# Altium project Control-Board-v1.0.PrjPcb (part 1 of 7)
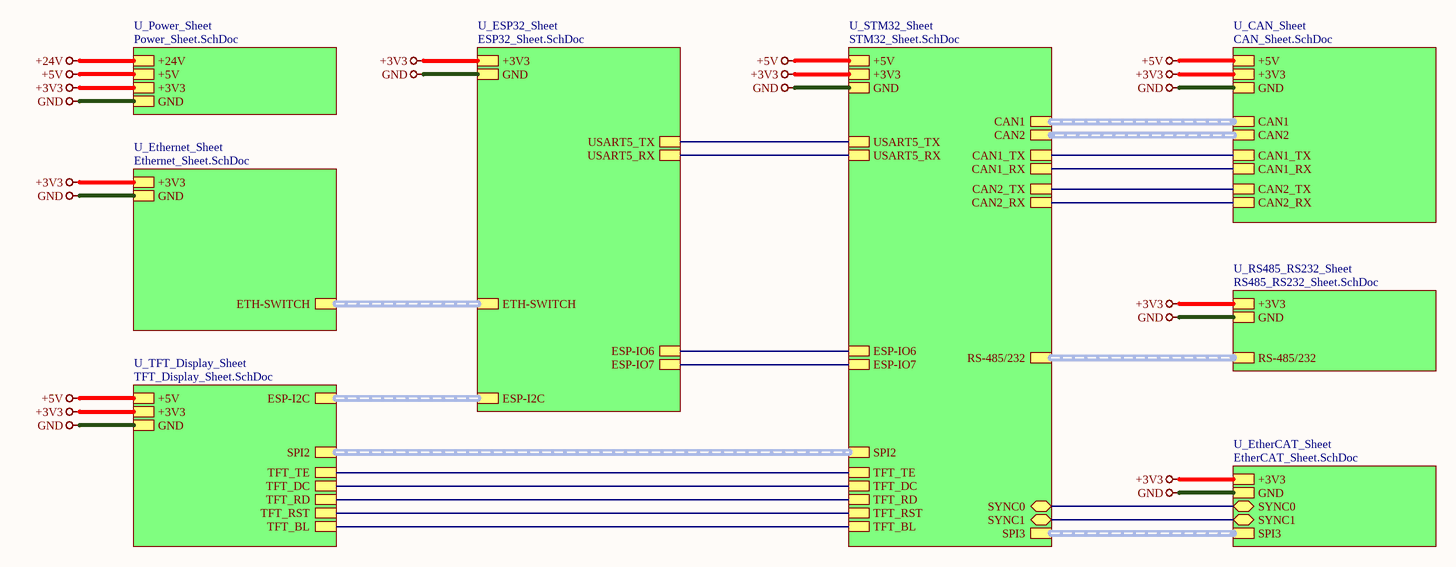
[diagram p0: Top-Sheet.SchDoc]
9 sheets, 501 parts. Net scope: hierarchical (ports join the sheet entries above them; power ports are global).
Board file: Control Board-v1.0.PcbDoc
Sheets:
  Top-Sheet.SchDoc
    U_Power_Sheet = Power_Sheet.SchDoc
    U_ESP32_Sheet = ESP32_Sheet.SchDoc
    U_CAN_Sheet = CAN_Sheet.SchDoc
    U_RS485_RS232_Sheet = RS485_RS232_Sheet.SchDoc
    U_TFT_Display_Sheet = TFT_Display_Sheet.SchDoc
    U_STM32_Sheet = STM32_Sheet.SchDoc
    U_EtherCAT_Sheet = EtherCAT_Sheet.SchDoc
    U_Ethernet_Sheet = Ethernet_Sheet.SchDoc

## Sheet Top-Sheet.SchDoc
size 420 x 297 mm; SheetNumber: 1; SheetTotal: 9

### Sub-sheets
U_CAN_Sheet = CAN_Sheet.SchDoc: CAN1 (harness CAN1), CAN2_RX, CAN2_TX, +5V, +3V3, GND, CAN1_RX, CAN1_TX, CAN2 (harness CAN2)
U_ESP32_Sheet = ESP32_Sheet.SchDoc: +3V3, GND, USART5_TX, USART5_RX, ESP-IO6, ESP-IO7, ESP-I2C (harness ESP-I2C), ETH-SWITCH (harness ETH-SWITCH)
U_EtherCAT_Sheet = EtherCAT_Sheet.SchDoc: +3V3, GND, SYNC0 (bidir), SYNC1 (bidir), SPI3 (harness SPI3)
U_Ethernet_Sheet = Ethernet_Sheet.SchDoc: +3V3, GND, ETH-SWITCH (harness ETH-SWITCH)
U_Power_Sheet = Power_Sheet.SchDoc: +24V, +5V, +3V3, GND
U_RS485_RS232_Sheet = RS485_RS232_Sheet.SchDoc: RS-485/232 (harness RS-485/232), +3V3, GND
U_STM32_Sheet = STM32_Sheet.SchDoc: USART5_TX, USART5_RX, CAN1 (harness CAN1), CAN2_RX, CAN2_TX, +5V, +3V3, GND, CAN1_RX, CAN1_TX, CAN2 (harness CAN2), SYNC0 (bidir), SYNC1 (bidir), SPI3 (harness SPI3), SPI2 (harness SPI2), ESP-IO6, ESP-IO7, TFT_TE, TFT_DC, TFT_RD, TFT_RST, RS-485/232 (harness RS-485/232), TFT_BL
U_TFT_Display_Sheet = TFT_Display_Sheet.SchDoc: +3V3, GND, +5V, ESP-I2C (harness ESP-I2C), SPI2 (harness SPI2), TFT_TE, TFT_DC, TFT_RD, TFT_RST, TFT_BL

### Nets
+3V3: sheet U_Power_Sheet/+3V3, sheet U_ESP32_Sheet/+3V3, sheet U_CAN_Sheet/+3V3, sheet U_RS485_RS232_Sheet/+3V3, sheet U_TFT_Display_Sheet/+3V3, sheet U_STM32_Sheet/+3V3, sheet U_EtherCAT_Sheet/+3V3, sheet U_Ethernet_Sheet/+3V3
+5V: sheet U_Power_Sheet/+5V, sheet U_CAN_Sheet/+5V, sheet U_TFT_Display_Sheet/+5V, sheet U_STM32_Sheet/+5V
GND: sheet U_Power_Sheet/GND, sheet U_ESP32_Sheet/GND, sheet U_CAN_Sheet/GND, sheet U_RS485_RS232_Sheet/GND, sheet U_TFT_Display_Sheet/GND, sheet U_STM32_Sheet/GND, sheet U_EtherCAT_Sheet/GND, sheet U_Ethernet_Sheet/GND
CAN1_RX: sheet U_CAN_Sheet/CAN1_RX, sheet U_STM32_Sheet/CAN1_RX
CAN1_TX: sheet U_CAN_Sheet/CAN1_TX, sheet U_STM32_Sheet/CAN1_TX
CAN2_RX: sheet U_CAN_Sheet/CAN2_RX, sheet U_STM32_Sheet/CAN2_RX
CAN2_TX: sheet U_CAN_Sheet/CAN2_TX, sheet U_STM32_Sheet/CAN2_TX
ESP-IO6: sheet U_ESP32_Sheet/ESP-IO6, sheet U_STM32_Sheet/ESP-IO6
ESP-IO7: sheet U_ESP32_Sheet/ESP-IO7, sheet U_STM32_Sheet/ESP-IO7
SYNC0: sheet U_STM32_Sheet/SYNC0, sheet U_EtherCAT_Sheet/SYNC0
SYNC1: sheet U_STM32_Sheet/SYNC1, sheet U_EtherCAT_Sheet/SYNC1
TFT_BL: sheet U_TFT_Display_Sheet/TFT_BL, sheet U_STM32_Sheet/TFT_BL
TFT_DC: sheet U_TFT_Display_Sheet/TFT_DC, sheet U_STM32_Sheet/TFT_DC
TFT_RD: sheet U_TFT_Display_Sheet/TFT_RD, sheet U_STM32_Sheet/TFT_RD
TFT_RST: sheet U_TFT_Display_Sheet/TFT_RST, sheet U_STM32_Sheet/TFT_RST
TFT_TE: sheet U_TFT_Display_Sheet/TFT_TE, sheet U_STM32_Sheet/TFT_TE
USART5_RX: sheet U_ESP32_Sheet/USART5_RX, sheet U_STM32_Sheet/USART5_RX
USART5_TX: sheet U_ESP32_Sheet/USART5_TX, sheet U_STM32_Sheet/USART5_TX

### Buses and harness runs
harness sheet U_CAN_Sheet/CAN1 = sheet U_STM32_Sheet/CAN1
harness sheet U_CAN_Sheet/CAN2 = sheet U_STM32_Sheet/CAN2
harness sheet U_ESP32_Sheet/ESP-I2C = sheet U_TFT_Display_Sheet/ESP-I2C
harness sheet U_ESP32_Sheet/ETH-SWITCH = sheet U_Ethernet_Sheet/ETH-SWITCH
harness sheet U_EtherCAT_Sheet/SPI3 = sheet U_STM32_Sheet/SPI3
harness sheet U_RS485_RS232_Sheet/RS-485/232 = sheet U_STM32_Sheet/RS-485/232
harness sheet U_STM32_Sheet/SPI2 = sheet U_TFT_Display_Sheet/SPI2

### Notes on the sheet
- File:
- Title:
- Date:
- Page
- Num:
- Total:
- Drawn By: Huzaifa Ali

## Sheet Power_Sheet.SchDoc
size 420 x 297 mm; SheetNumber: 2; SheetTotal: 9
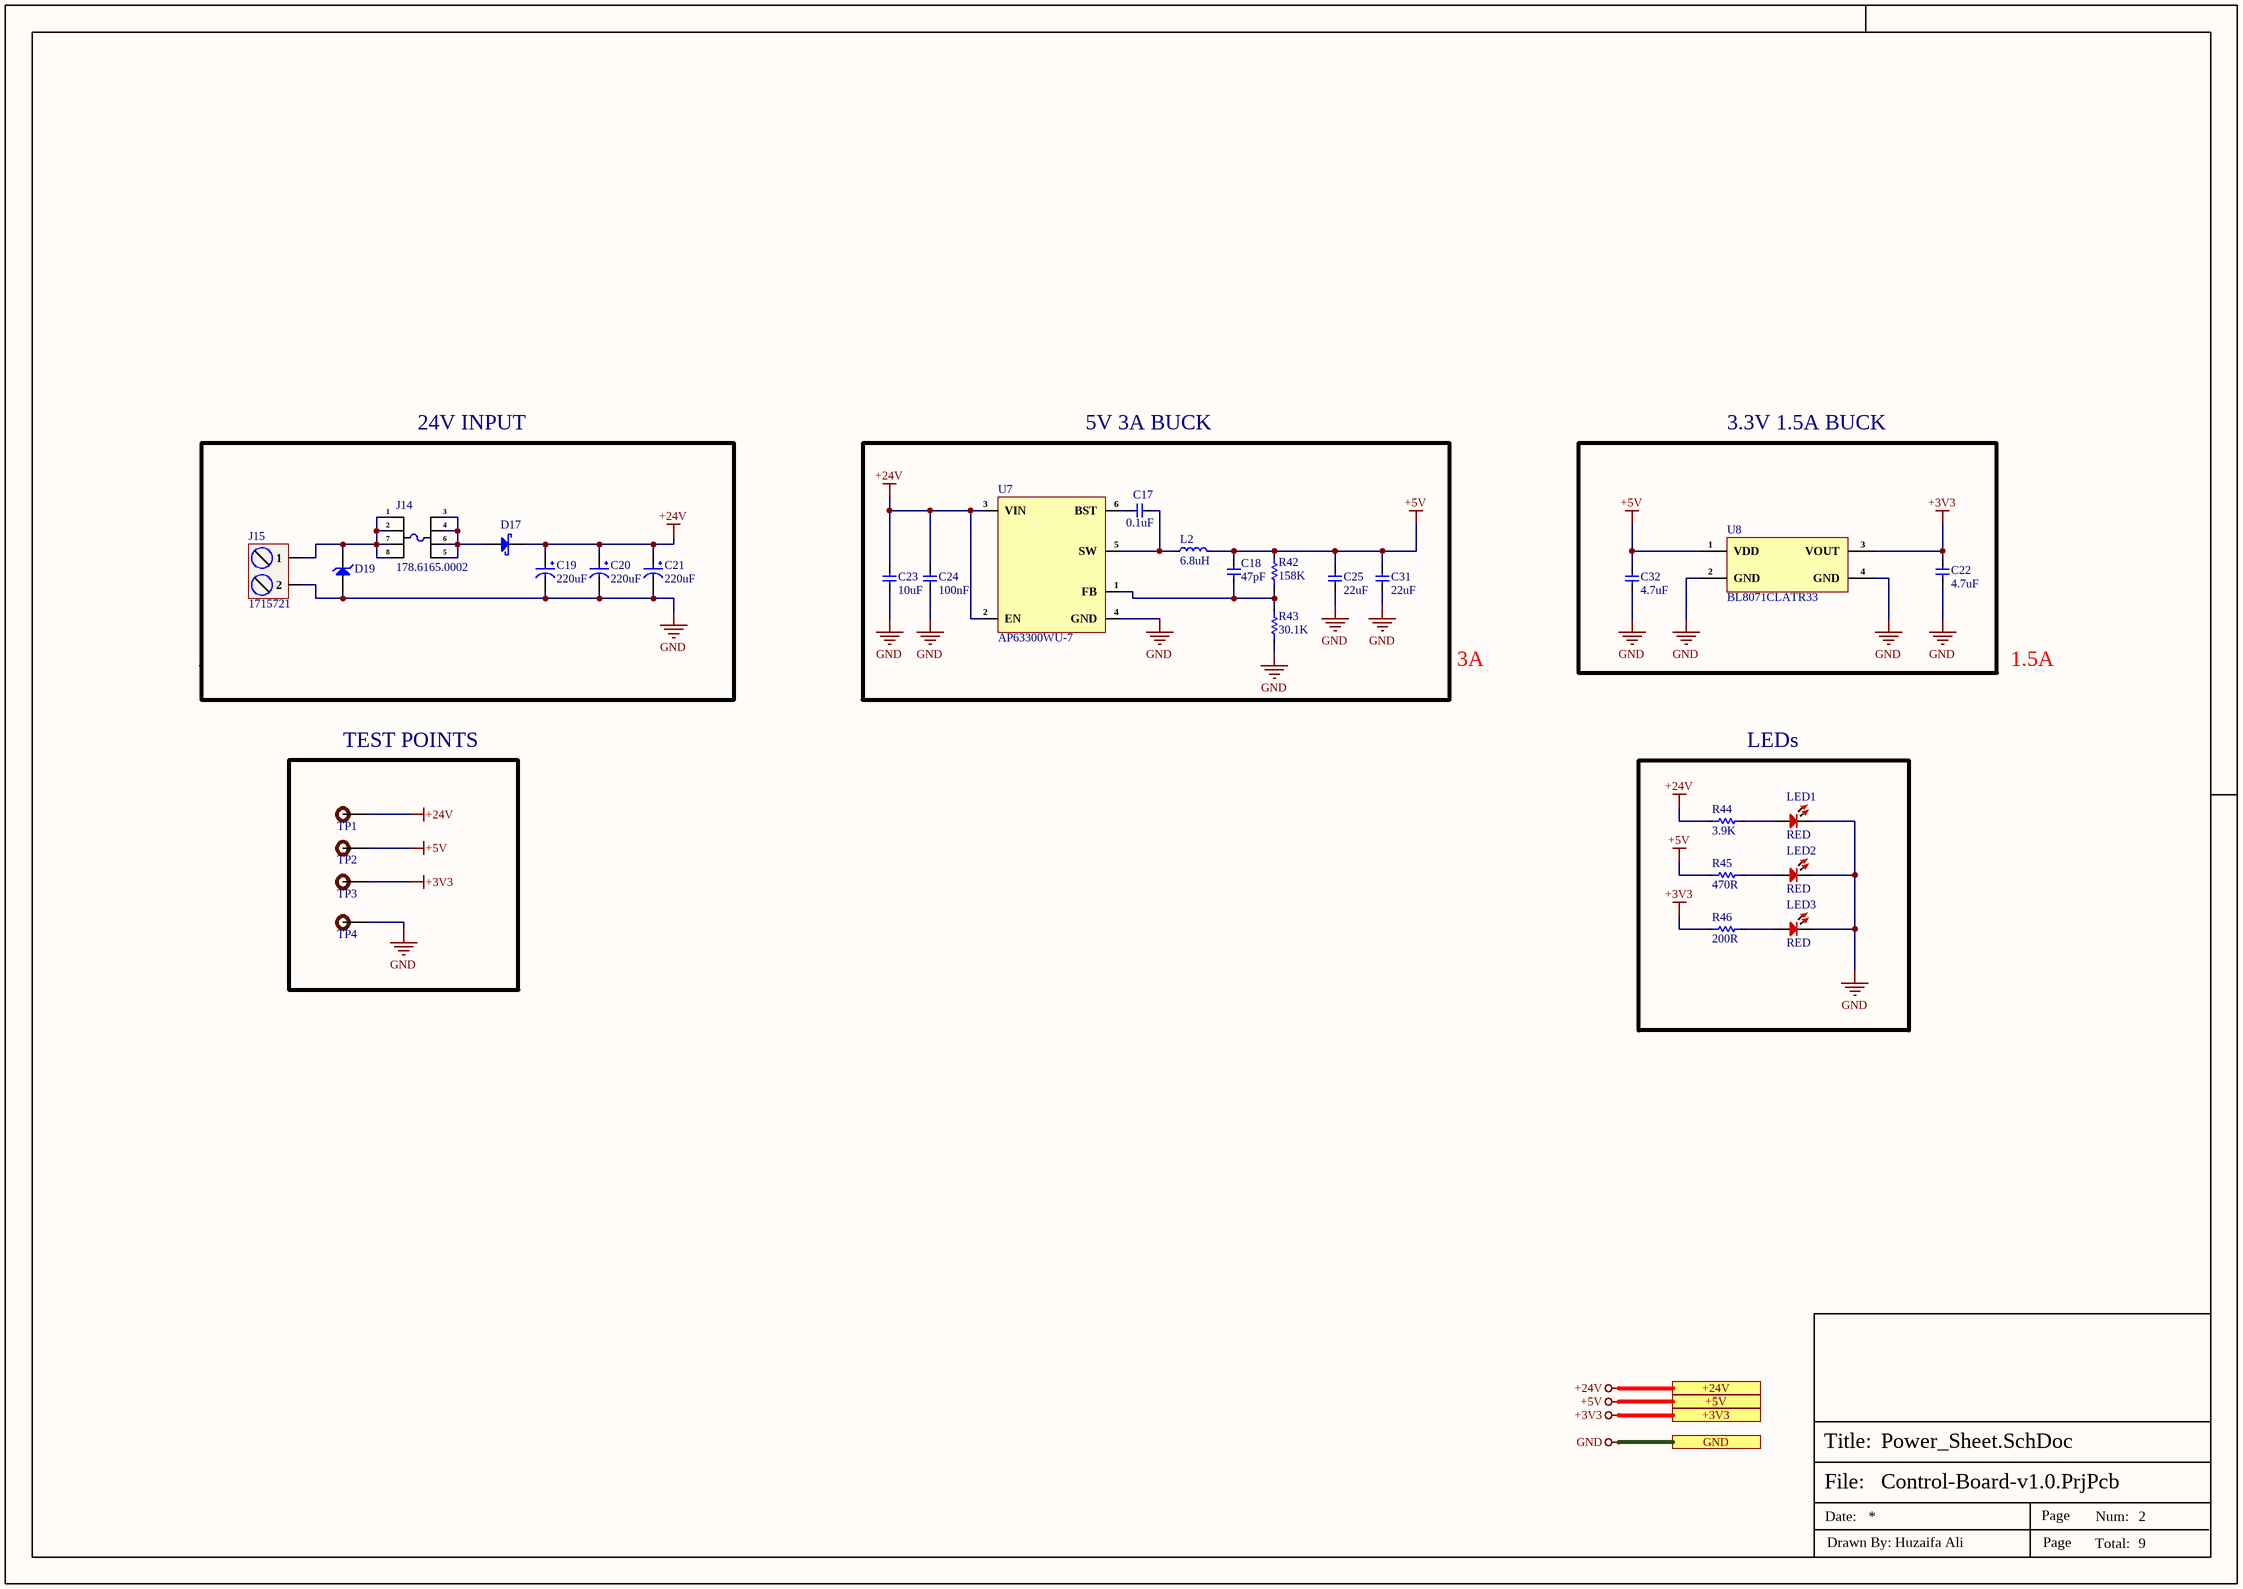
[diagram p1: Power_Sheet.SchDoc]

### Parts
C17  0.1uF  [Cap-0402]
C18  47pF  [Cap-0402]
C19  220uF  [UCD-220uF-10mmDia]
C20  220uF  [UCD-220uF-10mmDia]
C21  220uF  [UCD-220uF-10mmDia]
C22  4.7uF  [Cap-0603]
C23  10uF  [Cap-1206]
C24  100nF  [cap-0402]
C25  22uF  [Cap-0805]
C31  22uF  [Cap-0805]
C32  4.7uF  [Cap-0603]
D17  SS56  [SMA]  (value not drawn)
D19  SMBJ28A-13-F  [SMB_]  (value not drawn)
J14  178.6165.0002  [178.6165.0002]
J15  1715721  [1715721]
L2  6.8uH  [0630CDMCCDS_6R8MC]
LED1  RED  [LED-0603]
LED2  RED  [LED-0603]
LED3  RED  [LED-0603]
R42  158K  [Res-0402]
R43  30.1K  [Res-0402]
R44  3.9K  [Res-0402]
R45  470R  [Res-0402]
R46  200R  [Res-0402]
TP1  TEST POINT  [Test-point]  (value not drawn)  (no BOM)
TP2  TEST POINT  [Test-point]  (value not drawn)  (no BOM)
TP3  TEST POINT  [Test-point]  (value not drawn)  (no BOM)
TP4  TEST POINT  [Test-point]  (value not drawn)  (no BOM)
U7  AP63300WU-7  [TSOT-23-6]
U8  BL8071CLATR33  [SOT- 223]

### Blocks framed on the sheet
24V INPUT: C19-C21 D17 D19 J14 J15
5V 3A BUCK: C17 C18 C23-C25 C31 L2 R42 R43 U7
3.3V 1.5A BUCK: C22 C32 U8
TEST POINTS: TP1-TP4

### Ports
+3V3 (see Top-Sheet[2B], CAN_Sheet[5D], ESP32_Sheet[5D], EtherCAT_Sheet[5D], Ethernet_Sheet[5D], RS485_RS232_Sheet[5D], STM32_Sheet[5D], TFT_Display_Sheet[5D]), +5V (see Top-Sheet[2A], CAN_Sheet[5D], STM32_Sheet[5D], TFT_Display_Sheet[5D]), +24V (see Top-Sheet[2A]), GND (see Top-Sheet[2B], CAN_Sheet[5D], ESP32_Sheet[5D], EtherCAT_Sheet[5D], Ethernet_Sheet[5D], RS485_RS232_Sheet[5D], STM32_Sheet[5D], TFT_Display_Sheet[5D])

### Nets
+3V3: C22.2 R46.1 TP3.1 U8.3(VOUT) ; port +3V3
+5V: C18.2 C25.2 C31.2 C32.2 L2.2 R42.2 R45.1 TP2.1 U8.1(VDD) ; port +5V
+24V: C19.1 C20.1 C21.1 C23.2 C24.2 D17.1(K) R44.1 TP1.1 U7.2(EN) U7.3(VIN) ; port +24V
GND: C19.2 C20.2 C21.2 C22.1 C23.1 C24.1 C25.1 C31.1 C32.1 D19.1(A) J15.2 LED1.2 LED2.2 LED3.2 R43.1 TP4.1 U7.4(GND) U8.2(GND) U8.4(GND) ; port GND
NetC17_1: C17.1 L2.1 U7.5(SW)
NetC17_2: C17.2 U7.6(BST)
NetC18_1: C18.1 R42.1 R43.2 U7.1(FB)
NetD17_2: D17.2(A) J14.3 J14.4 J14.5 J14.6
NetD19_2: D19.2(K) J14.1 J14.2 J14.7 J14.8 J15.1
NetLED1_1: LED1.1 R44.2
NetLED2_1: LED2.1 R45.2
NetLED3_1: LED3.1 R46.2

### Notes on the sheet
- 3A
- 1.5A
- LEDs
- File:
- Title:
- Date:
- Page
- Num:
- Total:
- Drawn By: Huzaifa Ali

### Library data of the parts
C17 = C1005X5R1H104K050BB: CAP CER 0.1UF 50V X5R 0402; Manufacturer: TDK; Dielectric Material: Ceramic; Capacitance: 100nF; Tolerance: 10%; Item Type: Capacitor; Supplier 1: Digi-Key; Manufacturer Part Number: C1005X5R1H104K050BB; Stock 1: 1455182; Pricing 1: 1=0.12, 10=0.09, 50=0.049, 100=0.04, 500=0.02858, 1000=0.02245, 2500=0.02041, 5000=0.01878 (USD); Mount: Surface Mount; Case/Package: 0402; Case Code (Metric): 1005; Case Code (Imperial): 0402; Weight: 2.3E-05oz; Min Operating Temperature: -55°C; Max Operating Temperature: 85°C; Dielectric: X5R; Voltage Rating: 50V; Packaging: Tape and Reel; Voltage Rating (DC): 50V; Termination: SMD/SMT; Construction: Flat; Package Quantity: 1; Resistor Type: Ceramic; Voltage: 50V; Series: C; Length: 1mm; Width: 0.02inch; Height: 0.5mm; Depth: 0.5mm; Thickness: 0.022inch; Radiation Hardening: No; Lead Free: Lead Free; REACH SVHC: No SVHC; RoHS Compliant: Yes; ComponentLink1URL: https://product.tdk.com/info/en/catalog/spec/mlccspec_commercial_general_midvoltage_en.pdf?src-supplier=Digi-Key; ComponentLink1Description: https://product.tdk.com/info/en/catalog/spec/mlccspec_commercial_general_midvoltage_en.pdf?src-supplier=Digi-Key; ComponentLink2URL: http://www.tdk.co.jp/tefe02/e413_c.pdf?src-supplier=Future+Electronics; ComponentLink2Description: http://www.tdk.co.jp/tefe02/e413_c.pdf?src-supplier=Future+Electronics; ComponentLink3URL: https://www.verical.com/server-webapp/html/getDatasheet?partID=743571&src-supplier=Verical; ComponentLink3Description: https://www.verical.com/server-webapp/html/getDatasheet?partID=743571&src-supplier=Verical; ComponentLink4URL: http://www.tdk.co.jp/tefe02/e412_c.pdf?src-supplier=Avnet+Europe; ComponentLink4Description: http://www.tdk.co.jp/tefe02/e412_c.pdf?src-supplier=Avnet+Europe; Supplier Part Number 1: 445-5942-1-ND; LCSC Part Number: C2181865
C18 = GCM1555C1H470FA16D: CAP CER 47PF 50V C0G/NP0 0402; Manufacturer: Murata; Tolerance: 1%; Supplier 1: Digi-Key; Manufacturer Part Number: GCM1555C1H470FA16D; RoHS: No; Category: Ceramic Capacitors; Stock 1: 27098; Pricing 1: 1=0.11000, 10=0.07900, 50=0.04500, 100=0.03730, 500=0.02618, 1000=0.02168, 2500=0.02018, 5000=0.01846 (USD); Mount: Surface Mount; Case/Package: 0402; Case Code (Imperial): 0402; Case Code (Metric): 1005; Min Operating Temperature: -55°C; Max Operating Temperature: 125°C; Packaging: Tape and Reel; Capacitance: 47pF; Voltage Rating: 50V; Ratings: AEC-Q200; ComponentLink1URL: http://search.murata.co.jp/Ceramy/image/img/A01X/G101/ENG/GCM1555C1H470FA16-01.pdf?src-supplier=Digi-Key; ComponentLink1Description: http://search.murata.co.jp/Ceramy/image/img/A01X/G101/ENG/GCM1555C1H470FA16-01.pdf?src-supplier=Digi-Key; Supplier Part Number 1: 490-16445-1-ND; LCSC Part Number: C393684
C19-C21 = UCD1H221MNL1GS: CAP ALUM 220UF 20% 50V SMD; Manufacturer: Nichicon; Ripple Current: 700mA; Impedance: 160mR; Leakage Current: 3uA; Life (Hours): 5000Hour; Dissipation Factor: 0.1%; Item Type: Capacitor; Supplier 1: Digi-Key; Manufacturer Part Number: UCD1H221MNL1GS; RoHS: Yes; Category: Aluminum Electrolytic Capacitors; Pricing 1: 1=0.85000, 10=0.60200, 50=0.45480, 100=0.39620 (USD); Mount: Surface Mount,PCB; Case/Package: Radial; Min Operating Temperature: -55°C; Max Operating Temperature: 105°C; Capacitance: 220uF; Tolerance: 20%; Voltage Rating: 50V; Packaging: Tape and Reel; Package Quantity: 1; Voltage Rating (DC): 50V; Termination: SMD/SMT; Voltage: 50V; Features: General Purpose; Series: CD; Construction: Cylindrical; Diameter: 10mm; Length: 10mm; Height: 10mm; Height - Seated (Max): 0.394inch; Radiation Hardening: No; Lead Free: Lead Free; RoHS Compliant: Yes; ComponentLink1URL: https://datasheet.ciiva.com/11776/0900766b80ebdadd-11776792.pdf?src-supplier=RSComponents; ComponentLink1Description: https://datasheet.ciiva.com/11776/0900766b80ebdadd-11776792.pdf?src-supplier=RSComponents; ComponentLink2URL: https://datasheet.ciiva.com/5362/e-cd-22158-5362489.pdf?src-supplier=Mouser; ComponentLink2Description: https://datasheet.ciiva.com/5362/e-cd-22158-5362489.pdf?src-supplier=Mouser; ComponentLink3URL: https://datasheet.ciiva.com/11684/e-cd-11684678.pdf?src-supplier=Avnet; ComponentLink3Description: https://datasheet.ciiva.com/11684/e-cd-11684678.pdf?src-supplier=Avnet; ComponentLink4URL: https://datasheet.ciiva.com/15037/e-cd-15037119.pdf?src-supplier=Digi-Key; ComponentLink4Description: https://datasheet.ciiva.com/15037/e-cd-15037119.pdf?src-supplier=Digi-Key; ComponentLink5URL: https://datasheet.ciiva.com/16393/e-cd-16393493.pdf?src-supplier=Future+Electronics; ComponentLink5Description: https://datasheet.ciiva.com/16393/e-cd-16393493.pdf?src-supplier=Future+Electronics; ComponentLink6URL: https://datasheet.ciiva.com/17354/e-cd-17354606.pdf?src-supplier=Avnet+Europe; ComponentLink6Description: https://datasheet.ciiva.com/17354/e-cd-17354606.pdf?src-supplier=Avnet+Europe; Supplier Part Number 1: 493-6390-1-ND; LCSC Part Number: C116211
C22 C32 = CC0603KRX5R7BB475: CAP CER 4.7UF 16V X5R 0603; Manufacturer: Yageo; Tolerance: 10%; Item Type: Capacitor; Supplier 1: Digi-Key; Manufacturer Part Number: CC0603KRX5R7BB475; RoHS: Yes; Category: Ceramic Capacitors; Stock 1: 547703; Pricing 1: 1=0.20000, 10=0.13800, 50=0.08280, 100=0.06990, 500=0.04784, 1000=0.04233 (USD); Mount: Surface Mount; Case/Package: 0603; Case Code (Imperial): 0603; Case Code (Metric): 1608; Weight: 7.1E-05oz; Min Operating Temperature: -55°C; Max Operating Temperature: 85°C; Capacitance: 4.7uF; Voltage Rating: 16V; Voltage Rating (DC): 16V; Packaging: Tape and Reel; Dielectric: X5R; Termination: SMD/SMT; Resistor Type: Ceramic; Series: CC; Length: 1.6mm; Width: 0.8mm; Height: 0.8mm; Thickness: 0.037inch; Depth: 0.8mm; Lead Free: Lead Free; Halogen Free: Halogen Free; RoHS Compliant: Yes; ComponentLink1URL: http://www.mouser.com/ds/2/447/UPY-GPHC_X5R_4V-to-50V_25-1131599.pdf?src-supplier=Mouser; ComponentLink1Description: http://www.mouser.com/ds/2/447/UPY-GPHC_X5R_4V-to-50V_25-1131599.pdf?src-supplier=Mouser; ComponentLink2URL: http://www.yageo.com/documents/recent/UPY-GPHC_X5R_4V-to-50V_25.pdf?src-supplier=Digi-Key; ComponentLink2Description: http://www.yageo.com/documents/recent/UPY-GPHC_X5R_4V-to-50V_25.pdf?src-supplier=Digi-Key; Supplier Part Number 1: 311-1785-1-ND; LCSC Part Number: C277476
C23 = CC1206KKX5R9BB106: CAP CER 10UF 50V X5R 1206; Manufacturer: Yageo; Item Type: Capacitors; Material: 4241ConductorMaterial; Tolerance: 10%; Supplier: Future Electronics; Supplier Part Number: 2072123; Manufacturer Part Number: CC1206KKX5R9BB106; RoHS: Yes; Stock: 220000; Pricing: 2000=0.0907, 6000=0.0872, 10000=0.0856, 30000=0.0823, 50000=0.0795 (USD); Mounting Technology: Surface Mount; Case/Package: 1206; Case Code (Imperial): 1206; Case Code (Metric): 3216; Min Operating Temperature: -55°C; Max Operating Temperature: 85°C; Packaging: Cut Tape; Value: 10uF; Voltage Rating: 50V; Voltage Rating (DC): 50V; Dielectric: X5R; Series: CC; Length: 0.126inch; Width: 0.063inch; Height: 1.9mm; Thickness: 0.075inch; Lead Free: Lead Free; Halogen Free: Halogen Free; RoHS Compliant: Yes; ComponentLink1URL: https://datasheet.octopart.com/CC1206KKX5R9BB106-Yageo-datasheet-170350636.pdf?src-supplier=Future+Electronics; ComponentLink1Description: https://datasheet.octopart.com/CC1206KKX5R9BB106-Yageo-datasheet-170350636.pdf?src-supplier=Future+Electronics; ComponentLink2URL: https://datasheet.octopart.com/CC1206KKX5R9BB106-Yageo-datasheet-145016144.pdf?src-supplier=Future+Electronics; ComponentLink2Description: https://datasheet.octopart.com/CC1206KKX5R9BB106-Yageo-datasheet-145016144.pdf?src-supplier=Future+Electronics; ComponentLink3URL: http://www.yageo.com/documents/recent/UPY-GPHC_X5R_4V-to-50V_25.pdf?src-supplier=Digikey; ComponentLink3Description: http://www.yageo.com/documents/recent/UPY-GPHC_X5R_4V-to-50V_25.pdf?src-supplier=Digikey; LCSC Part Number: C100122
C24 = C1005X7R1H104KT000F: CAP CER 0.1UF 50V X7R 0402; Manufacturer: TDK; Tolerance: 10%; Voltage: 25V; Item Type: Capacitor; Supplier 1: Avnet; Manufacturer Part Number: C1005X7R1H104KT000F; RoHS: No; Category: Ceramic Capacitors; Dielectric: X7R; Supplier Part Number 1: C1005X7R1H104KT000F; LCSC Part Number: C361198; ComponentLink1Description: LCSC; ComponentLink1URL: https://www.lcsc.com/product-detail/Multilayer-Ceramic-Capacitors-MLCC-SMD-SMT_TDK-C1005X7R1H104KT000F_C361198.html
C25 C31 = CC0805MKX5R8BB226: CAP CER 22UF 25V X5R 0805; Manufacturer: Yageo; Tolerance: 20%; Item Type: Capacitor; Supplier 1: Digi-Key; Manufacturer Part Number: CC0805MKX5R8BB226; RoHS: Yes; Category: Ceramic Capacitors; Stock 1: 64970; Pricing 1: 1=0.47000, 10=0.33300, 50=0.25140, 100=0.21900, 500=0.16222, 1000=0.13789 (USD); Mount: Surface Mount; Case/Package: 0805; Case Code (Metric): 2012; Case Code (Imperial): 0805; Weight: 0.000194oz; Min Operating Temperature: -55°C; Max Operating Temperature: 85°C; Packaging: Tape and Reel; Capacitance: 22uF; Voltage Rating: 25V; Dielectric: X5R; Termination: SMD/SMT; Voltage Rating (DC): 25V; Package Quantity: 3000; Length: 0.079inch; Width: 0.049inch; Height: 1.25mm; Thickness: 0.057inch; Lead Free: Lead Free; Halogen Free: Halogen Free; RoHS Compliant: Yes; ComponentLink1URL: http://www.mouser.com/ds/2/447/Yageo_UPY-GP_NP0_16V-to-50V_9-358835.pdf?src-supplier=Mouser; ComponentLink1Description: http://www.mouser.com/ds/2/447/Yageo_UPY-GP_NP0_16V-to-50V_9-358835.pdf?src-supplier=Mouser; ComponentLink2URL: http://www.yageo.com/documents/recent/UPY-GPHC_X5R_4V-to-50V_25.pdf?src-supplier=Digi-Key; ComponentLink2Description: http://www.yageo.com/documents/recent/UPY-GPHC_X5R_4V-to-50V_25.pdf?src-supplier=Digi-Key; Supplier Part Number 1: 311-1903-1-ND; LCSC Part Number: C784585
D17 = SS56: DIODE SCHOTTKY 60V 5A SMA; Manufacturer: MDD; LCSC Par Number: C65009; Manufacturer Part Number: SS56; Iterm Type: Diode; ComponentLink1Description: LCSC; ComponentLink1URL: https://www.lcsc.com/product-detail/Schottky-Barrier-Diodes-SBD_MDD-Microdiode-Electronics-SS56_C65009.html
D19 = SMBJ28A-13-F: TVS DIODE 28VWM 45.4VC SMB; Manufacturer: Diodes; Test Current: 1mA; Number of Elements: 1; Power Dissipation: 600W; Forward Voltage: 5V; Direction: Unidirectional; Reverse Breakdown Voltage: 31.1V; Max Surge Current: 13.2A; Reverse Standoff Voltage: 28V; Clamping Voltage: 45.4V; Power Line Protection: No; Breakdown Voltage: 35.8V; Max Reverse Leakage Current: 5uA; Value: 330pF; Diode Type: ZENER; Supplier: Future Electronics; Supplier Part Number: 8797342; Manufacturer Part Number: SMBJ28A-13-F; RoHS: Yes; Category: TVS Diodes; Stock: 39000; Pricing: 3000=0.0734, 9000=0.0706, 15000=0.0693, 30000=0.0676, 60000=0.065 (USD); Mounting Technology: Surface Mount; Case/Package: SMB; Pins: 2; Min Operating Temperature: -55°C; Max Operating Temperature: 150°C; Packaging: Tape and Reel; Package Quantity: 3000; Max Power Dissipation: 600W; Series: SMBJ; Number of Unidirectional Channels: 1; Min Breakdown Voltage: 31.1V; Peak Pulse Power: 600W; Polarity: Unidirectional; Termination: SMD/SMT; Peak Pulse Current: 13.2A; Max Breakdown Voltage: 35.8V; Leakage Current: 5uA; Working Voltage: 28V; Voltage Rating (DC): 28V; Max Output current: 13.2A; Clamping Voltage-Max: 45.4V; Length: 4.57mm; Width: 3.9mm; Height: 2.62mm; Radiation Hardening: No; RoHS Compliant: Yes; Lead Free: Lead Free; ComponentLink1URL: https://datasheet.ciiva.com/16387/ds19002-16387564.pdf?src-supplier=Future+Electronics; ComponentLink1Description: https://datasheet.ciiva.com/16387/ds19002-16387564.pdf?src-supplier=Future+Electronics; ComponentLink2URL: https://datasheet.ciiva.com/26912/getdatasheetpartid-234000-26912533.pdf?src-supplier=Verical; ComponentLink2Description: https://datasheet.ciiva.com/26912/getdatasheetpartid-234000-26912533.pdf?src-supplier=Verical; Item Type: Diode
J14 = 178.6165.0002: FUSE HOLDER BLADE 80V PCB; Manufacturer: Littelfuse Wickmann; Body Material: 4896ConductorMaterial; Current Rating: 30A; Supplier: Future Electronics; Supplier Part Number: 9883406; Manufacturer Part Number: 178.6165.0002; RoHS: Yes; Category: Fuse Holders; Stock: 3811; Pricing: 1=2.02, 40=1.96, 125=1.91, 400=1.86, 1250=1.77 (USD); Material: 4896ConductorMaterial; Width: 17.5mm; Thickness: 6mm; Lead Free: 5697LeadFree; ComponentLink1URL: https://datasheet.ciiva.com/295/littelfuse-ato-pcb-fuse-holders-178-6765-295568.pdf?src-supplier=Digikey; ComponentLink1Description: https://datasheet.ciiva.com/295/littelfuse-ato-pcb-fuse-holders-178-6765-295568.pdf?src-supplier=Digikey; ComponentLink2URL: https://datasheet.ciiva.com/4480/flrholder-58019-4480354.pdf?src-supplier=Mouser; ComponentLink2Description: https://datasheet.ciiva.com/4480/flrholder-58019-4480354.pdf?src-supplier=Mouser; ComponentLink3URL: https://datasheet.ciiva.com/16372/flrholder-16372408.pdf?src-supplier=Future+Electronics; ComponentLink3Description: https://datasheet.ciiva.com/16372/flrholder-16372408.pdf?src-supplier=Future+Electronics; ComponentLink4URL: https://datasheet.ciiva.com/15187/getdatasheetpartid-31610-15187861.pdf?src-supplier=Verical; ComponentLink4Description: https://datasheet.ciiva.com/15187/getdatasheetpartid-31610-15187861.pdf?src-supplier=Verical; LCSC Part Number: C207061; Item Type: Fuse Holder
J15 = 1715721: TERM BLK 2P SIDE ENT 5.08MM PCB; Manufacturer: Phoenix Contact; Item Type: Terminal Blocks; Supplier: Digikey; Supplier Part Number: 277-1263-ND; Manufacturer Part Number: 1715721; RoHS: Yes; Stock: 13160; Pricing: 1=0.94 (USD); ComponentLink1URL: https://datasheet.ciiva.com/1120/1697161-1120393.pdf?src-supplier=Farnell; ComponentLink1Description: https://datasheet.ciiva.com/1120/1697161-1120393.pdf?src-supplier=Farnell; ComponentLink2URL: https://datasheet.ciiva.com/832/1715721-832095.pdf?src-supplier=Digikey; ComponentLink2Description: https://datasheet.ciiva.com/832/1715721-832095.pdf?src-supplier=Digikey; ComponentLink3URL: https://datasheet.ciiva.com/15169/getdatasheetpartid-212174-15169929.pdf?src-supplier=Verical; ComponentLink3Description: https://datasheet.ciiva.com/15169/getdatasheetpartid-212174-15169929.pdf?src-supplier=Verical; ComponentLink4URL: https://datasheet.ciiva.com/16046/1715721-16046034.pdf?src-supplier=Onlinecomponents.com; ComponentLink4Description: https://datasheet.ciiva.com/16046/1715721-16046034.pdf?src-supplier=Onlinecomponents.com
L2 = 0630CDMCCDS-6R8MC: FIXED IND 6.8UH 5A 48 MOHM SMD; Manufacturer: Sumida; Core Material: Metal; Saturation Current: 6.3A; Shielding: Shielded; DC Resistance (DCR): 48mR; Test Frequency: 100kHz; Tolerance: 20%; Item Type: Inductor; Supplier 1: Digi-Key; Manufacturer Part Number: 0630CDMCCDS-6R8MC; Stock 1: 1582; Pricing 1: 1=0.97, 10=0.845, 25=0.7848, 50=0.6642, 100=0.6038, 250=0.56752, 500=0.50716 (USD); Mount: Surface Mount; Case/Package: Nonstandard; Min Operating Temperature: -55°C; Max Operating Temperature: 125°C; Packaging: Tape and Reel; Inductance: 6.8uH; Current Rating: 5A; Length: 0.276inch; Width: 0.26inch; Height - Seated (Max): 0.118inch; RoHS Compliant: Yes; ComponentLink1URL: http://products.sumida.com/products/pdf/0630CDMCDDS.pdf?src-supplier=Digi-Key; ComponentLink1Description: http://products.sumida.com/products/pdf/0630CDMCDDS.pdf?src-supplier=Digi-Key; Supplier Part Number 1: 308-2467-1-ND; LCSC Part Number: C167295
LED1-LED3 = NCD0603R3: RED LED 0603 Light Emitting Diodes; Manufacturer: Foshan NationStar Optoelectronics; Manufacturer Part Number: NCD0603R3; Package: 0603; Item Type: LED; LCSC Part Number: C3151730; ComponentLink1Description: LCSC; ComponentLink1URL: https://www.lcsc.com/product-detail/Light-Emitting-Diodes-LED_Foshan-NationStar-Optoelectronics-NCD0603R3_C3151730.html
R42 = RT0402BRE07158KL: RES 158K OHM 0.1% 1/16W 0402; Manufacturer: Yageo; Item Type: Resistor; Supplier: Digikey; Supplier Part Number: RT0402BRE07158KL-ND; Manufacturer Part Number: RT0402BRE07158KL; RoHS: Yes; Pricing: 10000=0.08507 (USD); LCSC Part Number: C853045
R43 = RT0402BRD0730K1L: RES SMD 30.1KOHM 0.1% 1/16W 0402; Manufacturer: Yageo; Item Type: Resistor; Supplier: Rs; Supplier Part Number: 1991324P; Manufacturer Part Number: RT0402BRD0730K1L; RoHS: Yes; Category: Chip SMD Resistors; Stock: 7420; Pricing: 100=0.138, 250=0.115, 500=0.092, 1000=0.076 (GBP); ComponentLink1URL: https://datasheet.ciiva.com/12722/pyu-rt-1-to-0-05-rohs-l-4-12722119.pdf?src-supplier=Mouser; ComponentLink1Description: https://datasheet.ciiva.com/12722/pyu-rt-1-to-0-05-rohs-l-4-12722119.pdf?src-supplier=Mouser; ComponentLink2URL: https://datasheet.ciiva.com/2582/pyu-rt-1-to-0-05-rohs-l-5-2582303.pdf?src-supplier=Digi-Key; ComponentLink2Description: https://datasheet.ciiva.com/2582/pyu-rt-1-to-0-05-rohs-l-5-2582303.pdf?src-supplier=Digi-Key; LCSC Part Number: C852714
R44 = RC0402FR-073K9L: RES 3.9K OHM 1% 1/16W 0402; Manufacturer: Yageo; Temperature Coefficient: 100ppm/°C; Power Rating: 62.5mW; Value: 3.9kR; Voltage Rating: 50V; Max Power Dissipation: 63mW; Item Type: Resistor; Supplier: Future Electronics; Supplier Part Number: 9808155; Manufacturer Part Number: RC0402FR-073K9L; RoHS: Yes; Category: Chip SMD Resistors; Stock: 6910000; Pricing: 10000=0.0011, 100000=0.0011, 300000=0.001, 750000=0.001, 2000000=0.0009 (USD); Case/Package: 0402; Case Code (Imperial): 0402; Case Code (Metric): 1005; Min Operating Temperature: -55°C; Max Operating Temperature: 155°C; Tolerance: 1%; Packaging: Tape and Reel; Resistor Type: Thick Film; Series: RC; Termination: SMD/SMT; Number of Terminations: 2; Features: Moisture Resistant; Resistance Tolerance: 1%; Construction: Rectangular; Voltage Rating (AC): 50V; Length: 1mm; Depth: 0.5mm; Lead Free: Lead Free; RoHS Compliant: Yes; Reach SVHC Compliant: Unknown; Military Standard: Not; ComponentLink1URL: https://datasheet.ciiva.com/12666/pyu-rc0402-51-rohs-l-6-r-12666997.pdf?src-supplier=Mouser; ComponentLink1Description: https://datasheet.ciiva.com/12666/pyu-rc0402-51-rohs-l-6-r-12666997.pdf?src-supplier=Mouser; ComponentLink2URL: https://datasheet.ciiva.com/7849/1018594-7849989.pdf?src-supplier=Element14; ComponentLink2Description: https://datasheet.ciiva.com/7849/1018594-7849989.pdf?src-supplier=Element14; ComponentLink3URL: https://datasheet.ciiva.com/7849/1018594-7849990.pdf?src-supplier=Element14; ComponentLink3Description: https://datasheet.ciiva.com/7849/1018594-7849990.pdf?src-supplier=Element14; ComponentLink4URL: https://datasheet.ciiva.com/15189/getdatasheetpartid-469246-15189453.pdf?src-supplier=Verical; ComponentLink4Description: https://datasheet.ciiva.com/15189/getdatasheetpartid-469246-15189453.pdf?src-supplier=Verical; LCSC Part Number: C131467
R45 = RC0402FR-07470RL: RES 470 OHM 1% 1/16W 0402; Manufacturer: Yageo; Item Type: Resistor; Voltage Rating: 50V; Power Rating: 62.5mW; Temperature Coefficient: 100ppm/°C; Max Power Dissipation: 63mW; Supplier: Avnet; Supplier Part Number: RC0402FR-07470RL; Manufacturer Part Number: RC0402FR-07470RL; RoHS: Yes; Stock: 10000; Pricing: 10000=0.00085 (USD); Case/Package: 0402; Case Code (Metric): 1005; Case Code (Imperial): 0402; Min Operating Temperature: -55°C; Max Operating Temperature: 155°C; Packaging: Tape and Reel; Value: 470R; Tolerance: 1%; Number of Terminations: 2; Working Voltage: 50V; Package Quantity: 1; Resistor Type: Thick Film; Termination: SMD/SMT; Features: Moisture Resistant; Series: RC; Resistance Tolerance: 1%; Construction: Rectangular; Voltage Rating (AC): 50V; Length: 1mm; Width: 0.02inch; Height: 0.016inch; Depth: 0.5mm; Lead Free: Lead Free; Reach SVHC Compliant: No; RoHS Compliant: Yes; Military Standard: Not; ComponentLink1URL: https://datasheet.ciiva.com/46412/1018594-46412838.pdf?src-supplier=Element14; ComponentLink1Description: https://datasheet.ciiva.com/46412/1018594-46412838.pdf?src-supplier=Element14; ComponentLink2URL: https://datasheet.ciiva.com/2453/pyu-r-int-thick-7-2453377.pdf?src-supplier=Digikey; ComponentLink2Description: https://datasheet.ciiva.com/2453/pyu-r-int-thick-7-2453377.pdf?src-supplier=Digikey; ComponentLink3URL: https://datasheet.ciiva.com/2453/pyu-r-int-thick-7-2453378.pdf?src-supplier=Digikey; ComponentLink3Description: https://datasheet.ciiva.com/2453/pyu-r-int-thick-7-2453378.pdf?src-supplier=Digikey; ComponentLink4URL: https://datasheet.ciiva.com/2453/pyu-r-int-thick-7-2453376.pdf?src-supplier=Digikey; ComponentLink4Description: https://datasheet.ciiva.com/2453/pyu-r-int-thick-7-2453376.pdf?src-supplier=Digikey; ComponentLink5URL: https://datasheet.ciiva.com/7850/1018594-7850015.pdf?src-supplier=Element14; ComponentLink5Description: https://datasheet.ciiva.com/7850/1018594-7850015.pdf?src-supplier=Element14; ComponentLink6URL: https://datasheet.ciiva.com/7850/1018594-7850014.pdf?src-supplier=Element14; ComponentLink6Description: https://datasheet.ciiva.com/7850/1018594-7850014.pdf?src-supplier=Element14; ComponentLink7URL: https://datasheet.ciiva.com/15189/getdatasheetpartid-330246-15189463.pdf?src-supplier=Verical; ComponentLink7Description: https://datasheet.ciiva.com/15189/getdatasheetpartid-330246-15189463.pdf?src-supplier=Verical; LCSC Part Number: C114877
R46 = RC0402FR-07200RL: RES 200 OHM 1% 1/16W 0402; Manufacturer: Yageo; Temperature Coefficient: 100ppm/°C; Power Rating: 63mW; Voltage Rating (DC): 50V; Supplier 1: Digi-Key; Manufacturer Part Number: RC0402FR-07200RL; RoHS: Yes; Category: Chip SMD Resistors; Stock 1: 19778; Pricing 1: 1=0.10000, 10=0.01600, 100=0.00660, 1000=0.00299, 2500=0.00259, 5000=0.00214 (USD); Case/Package: 0402; Case Code (Metric): 1005; Case Code (Imperial): 0402; Size Code: 0402; Min Operating Temperature: -55°C; Max Operating Temperature: 155°C; Tolerance: 1%; Resistance: 200R; Resistor Type: Thick Film; Packaging: Tape and Reel; Voltage Rating: 50V; Package Quantity: 1; Number of Terminations: 2; Termination: SMD/SMT; Max Power Dissipation: 63mW; Features: Moisture Resistant; Series: RC; Construction: Rectangular; Resistance Tolerance: 1%; Length: 1mm; Width: 0.02inch; Height: 0.016inch; Depth: 0.5mm; REACH SVHC: No SVHC; Lead Free: Lead Free; RoHS Compliant: Yes; Military Standard: Not; ComponentLink1URL: https://datasheet.ciiva.com/2553/pyu-r-int-thick-7-2553232.pdf?src-supplier=Digi-Key; ComponentLink1Description: https://datasheet.ciiva.com/2553/pyu-r-int-thick-7-2553232.pdf?src-supplier=Digi-Key; ComponentLink2URL: https://datasheet.ciiva.com/7983/1018594-7983509.pdf?src-supplier=Element14; ComponentLink2Description: https://datasheet.ciiva.com/7983/1018594-7983509.pdf?src-supplier=Element14; ComponentLink3URL: https://datasheet.ciiva.com/16804/pyu-rc0402-51-rohs-l-6-r-16804406.pdf?src-supplier=Future+Electronics; ComponentLink3Description: https://datasheet.ciiva.com/16804/pyu-rc0402-51-rohs-l-6-r-16804406.pdf?src-supplier=Future+Electronics; ComponentLink4URL: https://datasheet.ciiva.com/15189/getdatasheetpartid-331152-15189383.pdf?src-supplier=Verical; ComponentLink4Description: https://datasheet.ciiva.com/15189/getdatasheetpartid-331152-15189383.pdf?src-supplier=Verical; ComponentLink5URL: https://datasheet.ciiva.com/7849/1018594-7849898.pdf?src-supplier=Element14; ComponentLink5Description: https://datasheet.ciiva.com/7849/1018594-7849898.pdf?src-supplier=Element14; ComponentLink6URL: https://datasheet.ciiva.com/5562/pyu-rc0402-51-rohs-l-6-r-8721-5562539.pdf?src-supplier=Mouser; ComponentLink6Description: https://datasheet.ciiva.com/5562/pyu-rc0402-51-rohs-l-6-r-8721-5562539.pdf?src-supplier=Mouser; ComponentLink7URL: https://datasheet.ciiva.com/7849/1018594-7849899.pdf?src-supplier=Element14; ComponentLink7Description: https://datasheet.ciiva.com/7849/1018594-7849899.pdf?src-supplier=Element14; ComponentLink8URL: https://datasheet.ciiva.com/2553/pyu-r-int-thick-7-2553230.pdf?src-supplier=Digi-Key; ComponentLink8Description: https://datasheet.ciiva.com/2553/pyu-r-int-thick-7-2553230.pdf?src-supplier=Digi-Key; ComponentLink9URL: https://datasheet.ciiva.com/2553/pyu-r-int-thick-7-2553231.pdf?src-supplier=Digi-Key; ComponentLink9Description: https://datasheet.ciiva.com/2553/pyu-r-int-thick-7-2553231.pdf?src-supplier=Digi-Key; Supplier Part Number 1: 311-200LRCT-ND; LCSC Part Number: C114764
TP1-TP4 = TEST POINT: Test Point ON; Item Type: TEST POINT
U7 = AP63300WU-7: IC REG BUCK ADJ 3A TSOT26; Manufacturer: Diodes; Output Type: Adjustable; Output Configuration: Positive; Number of Outputs: 1; Min Input Voltage: 3.8V; Max Supply Voltage: 32V; Min Output Voltage: 800mV; Max Output Voltage: 31V; Switching Frequency: 500kHz; Synchronous Rectifier: Yes; Supplier: Digikey; Supplier Part Number: 31-AP63300WU-7CT-ND; Manufacturer Part Number: AP63300WU-7; RoHS: No; Category: Voltage Regulators - Switching; Stock: 11398; Pricing: 1=0.92, 10=0.818, 25=0.7764, 100=0.6379, 250=0.59628, 500=0.52696, 1000=0.41602 (USD); Mounting Technology: Surface Mount; Case/Package: SOT-23-6; Min Operating Temperature: -40°C; Max Operating Temperature: 85°C; Series: -; Output Current: 3A; RoHS Compliant: Yes; ComponentLink1URL: https://www.diodes.com/assets/Datasheets/AP63300-AP63301.pdf?src-supplier=Digikey; ComponentLink1Description: https://www.diodes.com/assets/Datasheets/AP63300-AP63301.pdf?src-supplier=Digikey; ComponentLink2URL: https://datasheet.octopart.com/AP63300WU-7-Diodes-Inc.-datasheet-149521342.pdf?src-supplier=Future+Electronics; ComponentLink2Description: https://datasheet.octopart.com/AP63300WU-7-Diodes-Inc.-datasheet-149521342.pdf?src-supplier=Future+Electronics; LCSC Part Number: C2158012; Item Type: IC
U8 = BL8071CLATR33: 70dB@(100Hz) 1.5A Fixed 3.3V~3.3V Positive 6V SOT-223 Linear Voltage Regulators (LDO) ROHS; Manufacturer: BL(Shanghai Belling); Item Type: IC; Manufacturer Part Number: BL8071CLATR33; Package: SOT-223; LCSC Part Number: C401677; ComponentLink1Description: LCSC; ComponentLink1URL: https://www.lcsc.com/product-detail/Linear-Voltage-Regulators-LDO_BL-Shanghai-Belling-BL8071CLATR33_C401677.html

## Sheet ESP32_Sheet.SchDoc
size 420 x 297 mm; SheetNumber: 3; SheetTotal: 9
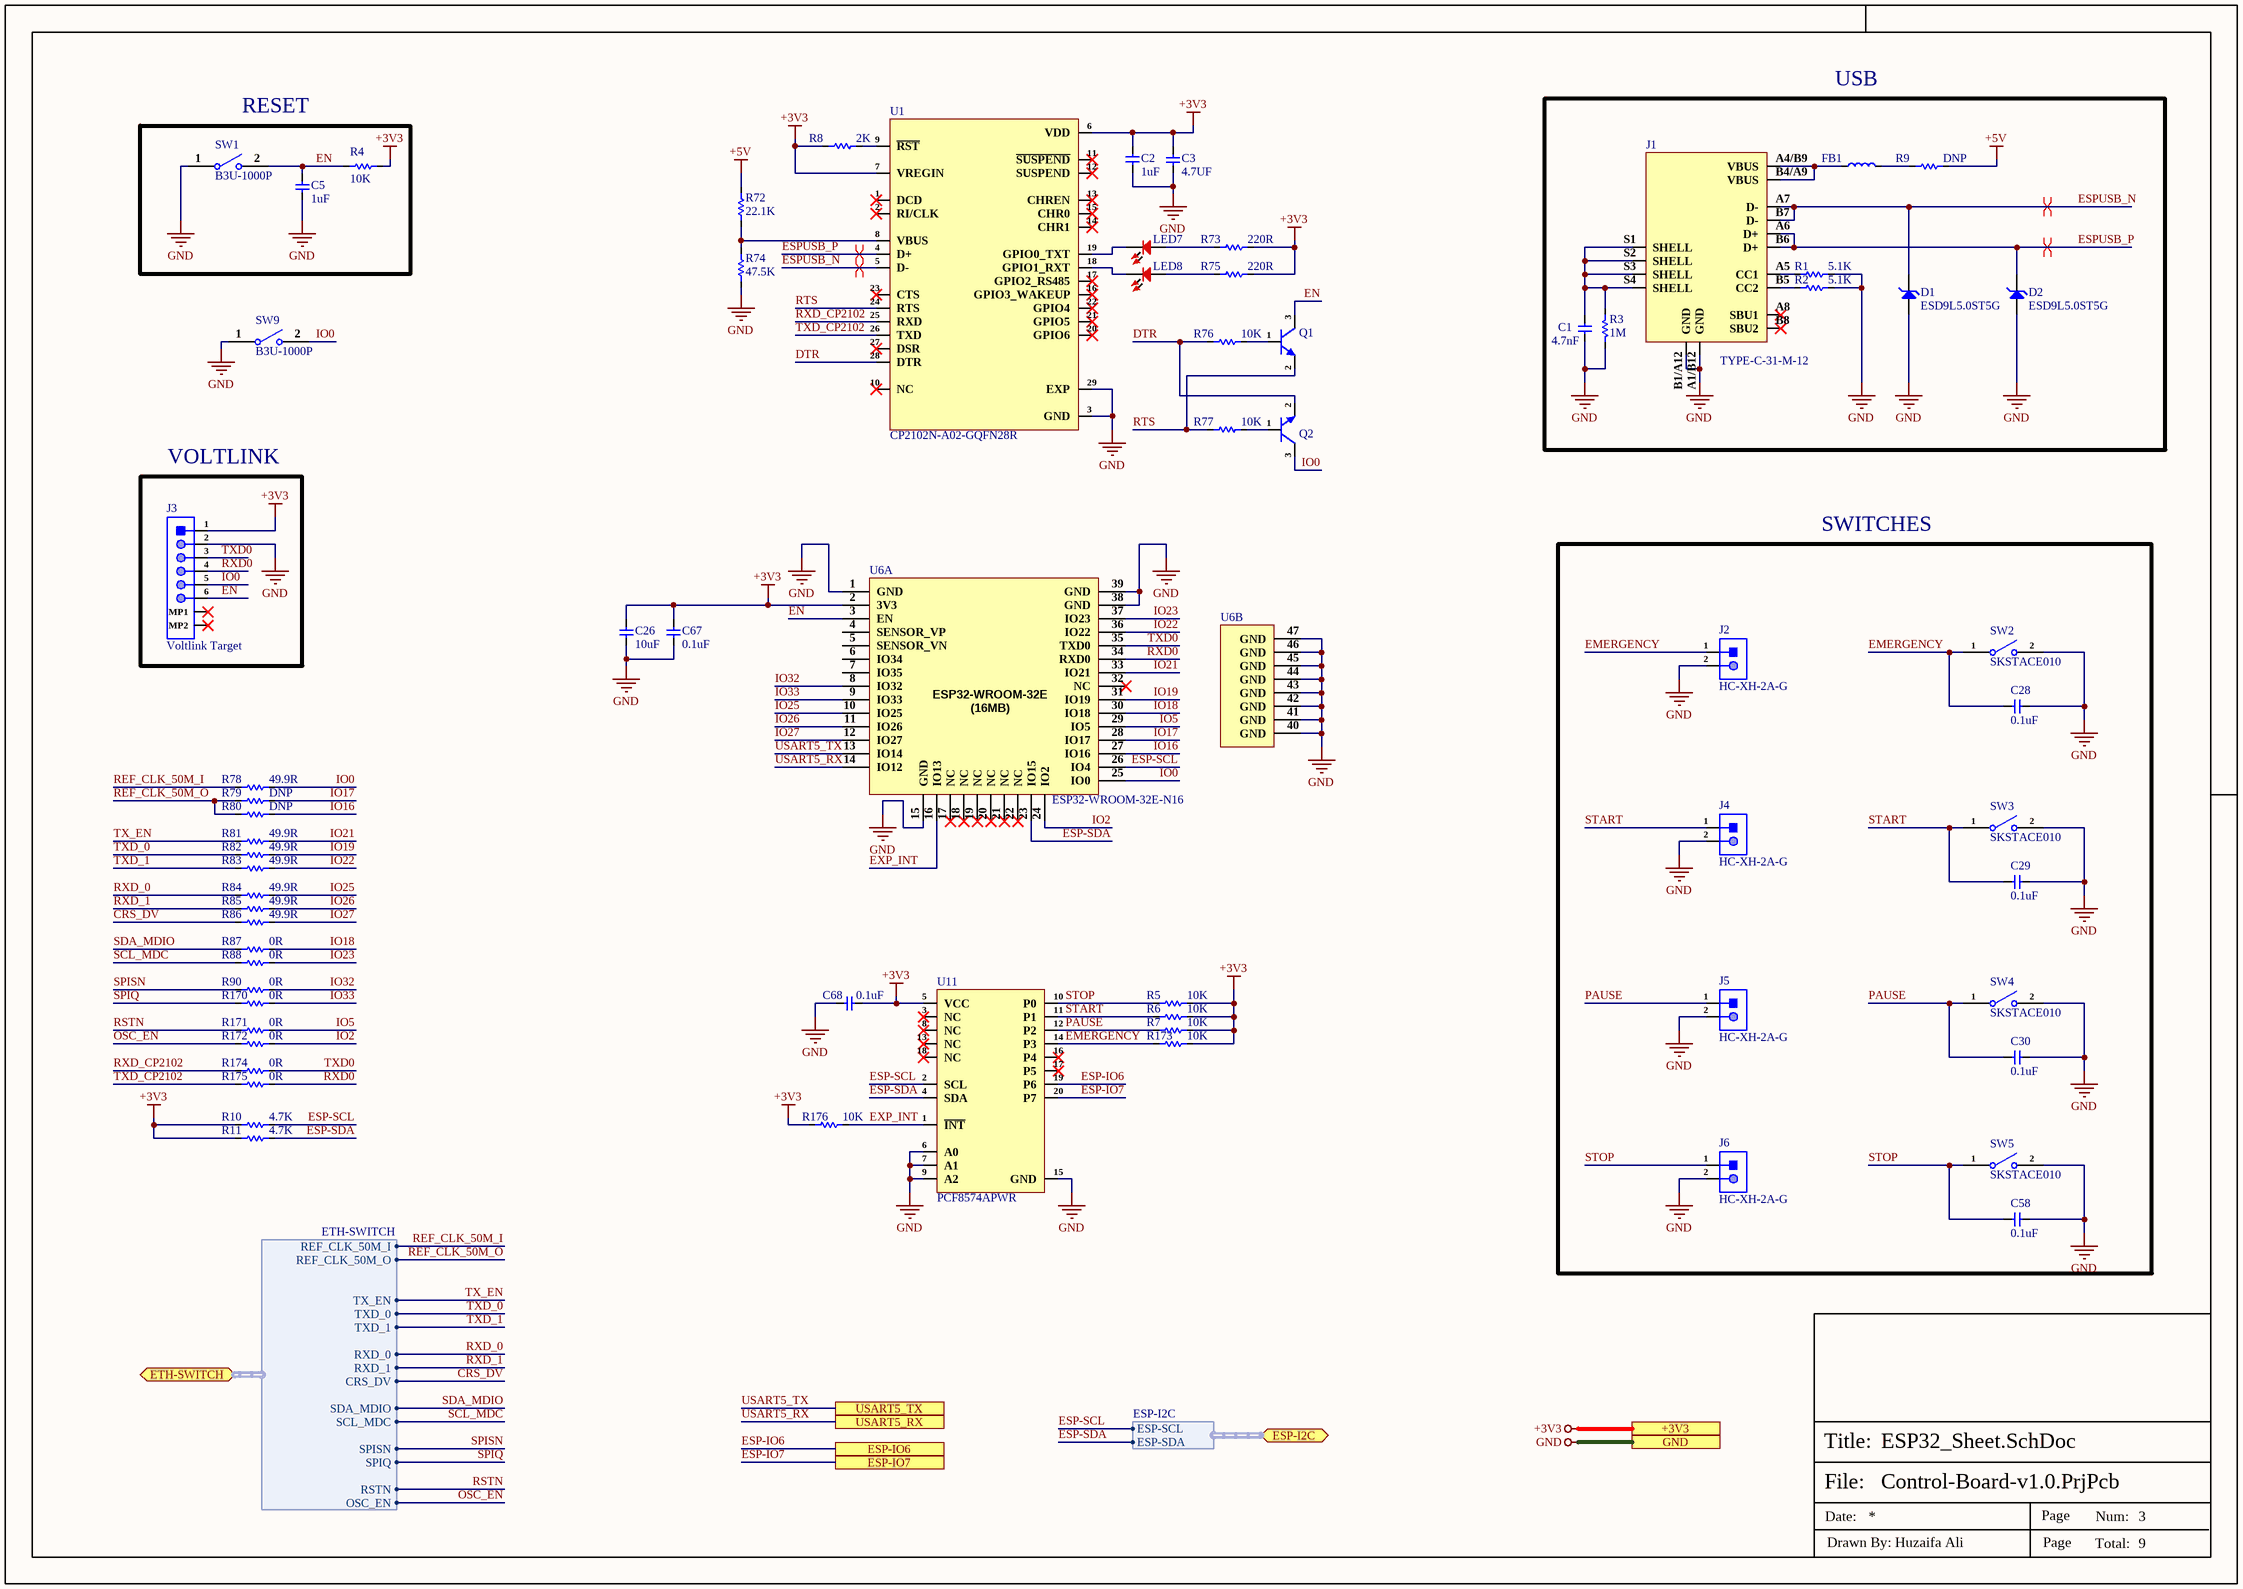
[diagram p2: ESP32_Sheet.SchDoc]

### Parts
C1  4.7nF  [Cap-0603]
C2  1uF  [Cap-0402]
C3  4.7UF  [Cap-0603]
C5  1uF  [Cap-0402]
C26  10uF  [Cap-0603]
C28  0.1uF  [Cap-0402]
C29  0.1uF  [Cap-0402]
C30  0.1uF  [Cap-0402]
C58  0.1uF  [Cap-0402]
C67  0.1uF  [Cap-0402]
C68  0.1uF  [Cap-0402]
D1  ESD9L5.0ST5G  [SOD-923.]
D2  ESD9L5.0ST5G  [SOD-923.]
FB1  BLM18PG221SN1D  [IND-0603 (1608 Metric)]  (value not drawn)
J1  TYPE-C-31-M-12  [TYPE-C-31-M-12_]
J2  HC-XH-2A-G  [HC-XH-2A-G]
J3  Voltlink Target  [Voltlink Target]
J4  HC-XH-2A-G  [HC-XH-2A-G]
J5  HC-XH-2A-G  [HC-XH-2A-G]
J6  HC-XH-2A-G  [HC-XH-2A-G]
LED7  RED  [LED-0603]  (value not drawn)
LED8  RED  [LED-0603]  (value not drawn)
Q1  SS8050-G  [SOT-23]  (value not drawn)
Q2  SS8050-G  [SOT-23]  (value not drawn)
R1  5.1K  [Res-0402]
R2  5.1K  [Res-0402]
R3  1M  [Res-0402]
R4  10K  [Res-0402]
R5  10K  [Res-0402]
R6  10K  [Res-0402]
R7  10K  [Res-0402]
R8  2K  [Res-0402]
R9  DNP  [Res-0402]
R10  4.7K  [Res-0402]
R11  4.7K  [Res-0402]
R72  22.1K  [Res-0603]
R73  220R  [Res-0603]
R74  47.5K  [Res-0603]
R75  220R  [Res-0603]
R76  10K  [Res-0402]
R77  10K  [Res-0402]
R78  49.9R  [Res-0603]
R79  DNP  [Res-0603]
R80  DNP  [Res-0603]
R81  49.9R  [Res-0603]
R82  49.9R  [Res-0603]
R83  49.9R  [Res-0603]
R84  49.9R  [Res-0603]
R85  49.9R  [Res-0603]
R86  49.9R  [Res-0603]
R87  0R  [Res-0603]
R88  0R  [Res-0603]
R90  0R  [Res-0603]
R170  0R  [Res-0603]
R171  0R  [Res-0603]
R172  0R  [Res-0603]
R173  10K  [Res-0402]
R174  0R  [Res-0603]
R175  0R  [Res-0603]
R176  10K  [Res-0402]
SW1  B3U-1000P  [B3U-1000P]
SW2  SKSTACE010  [SKSTACE010_]
SW3  SKSTACE010  [SKSTACE010_]
SW4  SKSTACE010  [SKSTACE010_]
SW5  SKSTACE010  [SKSTACE010_]
SW9  B3U-1000P  [B3U-1000P]
U1  CP2102N-A02-GQFN28R  [28-QFN (5x5)_]
U6  ESP32-WROOM-32E-N16  [38-SMD Module]  (parts A,B of 2)
U11  PCF8574APWR  [TSSOP-20]

### Blocks framed on the sheet
USB: C1 D1 D2 FB1 J1 R1-R3 R9
RESET: C5 R4 SW1
VOLTLINK: J3
SWITCHES: C28-C30 C58 J2 J4-J6 SW2-SW5

### Ports
+3V3 (see Top-Sheet[3A], CAN_Sheet[5D], EtherCAT_Sheet[5D], Ethernet_Sheet[5D], Power_Sheet[5D], RS485_RS232_Sheet[5D], STM32_Sheet[5D], TFT_Display_Sheet[5D]), ESP-I2C (bidir, harness ESP-I2C, see Top-Sheet[3B], TFT_Display_Sheet[2D]), ESP-IO6 (see Top-Sheet[3B], STM32_Sheet[4D]), ESP-IO7 (see Top-Sheet[3B], STM32_Sheet[4D]), ETH-SWITCH (bidir, harness ETH-SWITCH, see Top-Sheet[3B], Ethernet_Sheet[1D]), GND (see Top-Sheet[3A], CAN_Sheet[5D], EtherCAT_Sheet[5D], Ethernet_Sheet[5D], Power_Sheet[5D], RS485_RS232_Sheet[5D], STM32_Sheet[5D], TFT_Display_Sheet[5D]), USART5_RX (see Top-Sheet[3B], STM32_Sheet[4D]), USART5_TX (see Top-Sheet[3B], STM32_Sheet[4D])

### Harnesses
ESP-I2C: ESP-SCL, ESP-SDA
ETH-SWITCH: REF_CLK_50M_I, REF_CLK_50M_O, TX_EN, TXD_0, TXD_1, RXD_0, RXD_1, CRS_DV, SDA_MDIO, SCL_MDC, SPISN, SPIQ, RSTN, OSC_EN

### Nets
+3V3: C2.1 C3.2 C26.2 C67.2 C68.1 J3.1 R4.2 R5.2 R6.2 R7.2 R8.1 R10.2 R11.2 R73.2 R75.2 R173.2 R176.1 U1.6(VDD) U1.7(VREGIN) U6.2(3V3) U11.5(VCC) ; port +3V3
+5V: R9.2 R72.1
GND: C1.1 C2.2 C3.1 C5.1 C26.1 C28.1 C29.1 C30.1 C58.1 C67.1 C68.2 D1.2(A) D2.2(A) J1.A1/B12(GND) J1.B1/A12(GND) J2.2 J3.2 J4.2 J5.2 J6.2 R1.2 R2.2 R3.2 R74.1 SW1.1 SW2.2 SW3.2 SW4.2 SW5.2 SW9.1 U1.3(GND) U1.29(EXP) U6.1(GND) U6.15(GND) U6.38(GND) U6.39(GND) U6.40(GND) U6.41(GND) U6.42(GND) U6.43(GND) U6.44(GND) U6.45(GND) U6.46(GND) U6.47(GND) U11.6(A0) U11.7(A1) U11.9(A2) U11.15(GND) ; port GND
CRS_DV: R86.1 ; port ETH-SWITCH.CRS_DV
DTR: Q2.2(E) R76.1 U1.28(DTR)
EMERGENCY: C28.2 J2.1 R173.1 SW2.1 U11.14(P3)
EN: C5.2 J3.6 Q1.3(C) R4.1 SW1.2 U6.3(EN)
ESP-IO6: U11.19(P6) ; port ESP-IO6
ESP-IO7: U11.20(P7) ; port ESP-IO7
ESP-SCL: R10.1 U6.26(IO4) U11.2(SCL) ; port ESP-I2C.ESP-SCL
ESP-SDA: R11.1 U6.23(IO15) U11.4(SDA) ; port ESP-I2C.ESP-SDA
ESPUSB_N: D1.1(K) J1.A7(D-) J1.B7(D-) U1.5(D-)
ESPUSB_P: D2.1(K) J1.A6(D+) J1.B6(D+) U1.4(D+)
EXP_INT: R176.2 U6.16(IO13) U11.1(~{INT})
IO0: J3.5 Q2.3(C) R78.2 SW9.2 U6.25(IO0)
IO2: R172.2 U6.24(IO2)
IO5: R171.2 U6.29(IO5)
IO16: R80.2 U6.27(IO16)
IO17: R79.2 U6.28(IO17)
IO18: R87.2 U6.30(IO18)
IO19: R82.2 U6.31(IO19)
IO21: R81.2 U6.33(IO21)
IO22: R83.2 U6.36(IO22)
IO23: R88.2 U6.37(IO23)
IO25: R84.2 U6.10(IO25)
IO26: R85.2 U6.11(IO26)
IO27: R86.2 U6.12(IO27)
IO32: R90.2 U6.8(IO32)
IO33: R170.2 U6.9(IO33)
OSC_EN: R172.1 ; port ETH-SWITCH.OSC_EN
PAUSE: C30.2 J5.1 R7.1 SW4.1 U11.12(P2)
REF_CLK_50M_I: R78.1 ; port ETH-SWITCH.REF_CLK_50M_I
REF_CLK_50M_O: R79.1 R80.1 ; port ETH-SWITCH.REF_CLK_50M_O
RSTN: R171.1 ; port ETH-SWITCH.RSTN
RTS: Q1.2(E) R77.1 U1.24(RTS)
RXD0: J3.4 R175.2 U6.34(RXD0)
RXD_0: R84.1 ; port ETH-SWITCH.RXD_0
RXD_1: R85.1 ; port ETH-SWITCH.RXD_1
RXD_CP2102: R174.1 U1.25(RXD)
SCL_MDC: R88.1 ; port ETH-SWITCH.SCL_MDC
SDA_MDIO: R87.1 ; port ETH-SWITCH.SDA_MDIO
SPIQ: R170.1 ; port ETH-SWITCH.SPIQ
SPISN: R90.1 ; port ETH-SWITCH.SPISN
START: C29.2 J4.1 R6.1 SW3.1 U11.11(P1)
STOP: C58.2 J6.1 R5.1 SW5.1 U11.10(P0)
TX_EN: R81.1 ; port ETH-SWITCH.TX_EN
TXD0: J3.3 R174.2 U6.35(TXD0)
TXD_0: R82.1 ; port ETH-SWITCH.TXD_0
TXD_1: R83.1 ; port ETH-SWITCH.TXD_1
TXD_CP2102: R175.1 U1.26(TXD)
USART5_RX: U6.14(IO12) ; port USART5_RX
USART5_TX: U6.13(IO14) ; port USART5_TX
NetC1_2: C1.2 J1.S1(SHELL) J1.S2(SHELL) J1.S3(SHELL) J1.S4(SHELL) R3.1
NetFB1_1: FB1.1 J1.A4/B9(VBUS) J1.B4/A9(VBUS)
NetFB1_2: FB1.2 R9.1
NetJ1_A5: J1.A5(CC1) R1.1
NetJ1_B5: J1.B5(CC2) R2.1
NetLED7_1: LED7.1 R73.1
NetLED7_2: LED7.2 U1.19(GPIO0_TXT)
NetLED8_1: LED8.1 R75.1
NetLED8_2: LED8.2 U1.18(GPIO1_RXT)
NetQ1_1: Q1.1(B) R76.2
NetQ2_1: Q2.1(B) R77.2
NetR8_2: R8.2 U1.9(~{RST})
NetR72_2: R72.2 R74.2 U1.8(VBUS)

Not connected (* = marked no-connect by the designer): J1 A8(SBU1)* B8(SBU2)*; J3 MP1* MP2*; U1 1(DCD)* 2(RI/CLK)* 10(NC)* 11(~{SUSPEND})* 12(SUSPEND)* 13(CHREN)* 14(CHR1)* 15(CHR0)* 16(GPIO3_WAKEUP)* 17(GPIO2_RS485)* 20(GPIO6)* 21(GPIO5)* 22(GPIO4)* 23(CTS)* 27(DSR)*; U6 4(SENSOR_VP) 5(SENSOR_VN) 6(IO34) 7(IO35) 17(NC)* 18(NC)* 19(NC)* 20(NC)* 21(NC)* 22(NC)* 32(NC)*; U11 3(NC)* 8(NC)* 13(NC)* 16(P4)* 17(P5)* 18(NC)*

### Layout directives
differential pair; net class USB_PROGRAM; differential pair class USB_PROGRAM_LINES; rule Impedance Constraint [Min = 85.00    Max = 90.00    ]; rule Matched Net Lengths [Tolerance = 50mil]: ESPUSB_N, ESPUSB_P
differential pair; net class USB; differential pair class USB_Lines; rule Impedance Constraint [Min = 85.00    Max = 90.00    ]; rule Matched Net Lengths [Tolerance = 50mil]: ESPUSB_N, ESPUSB_P

### Notes on the sheet
- File:
- Title:
- Date:
- Page
- Num:
- Total:
- Drawn By: Huzaifa Ali
- (in symbol ESP32-WROOM-32E-N16, part A) ESP32-WROOM-32E (16MB) /